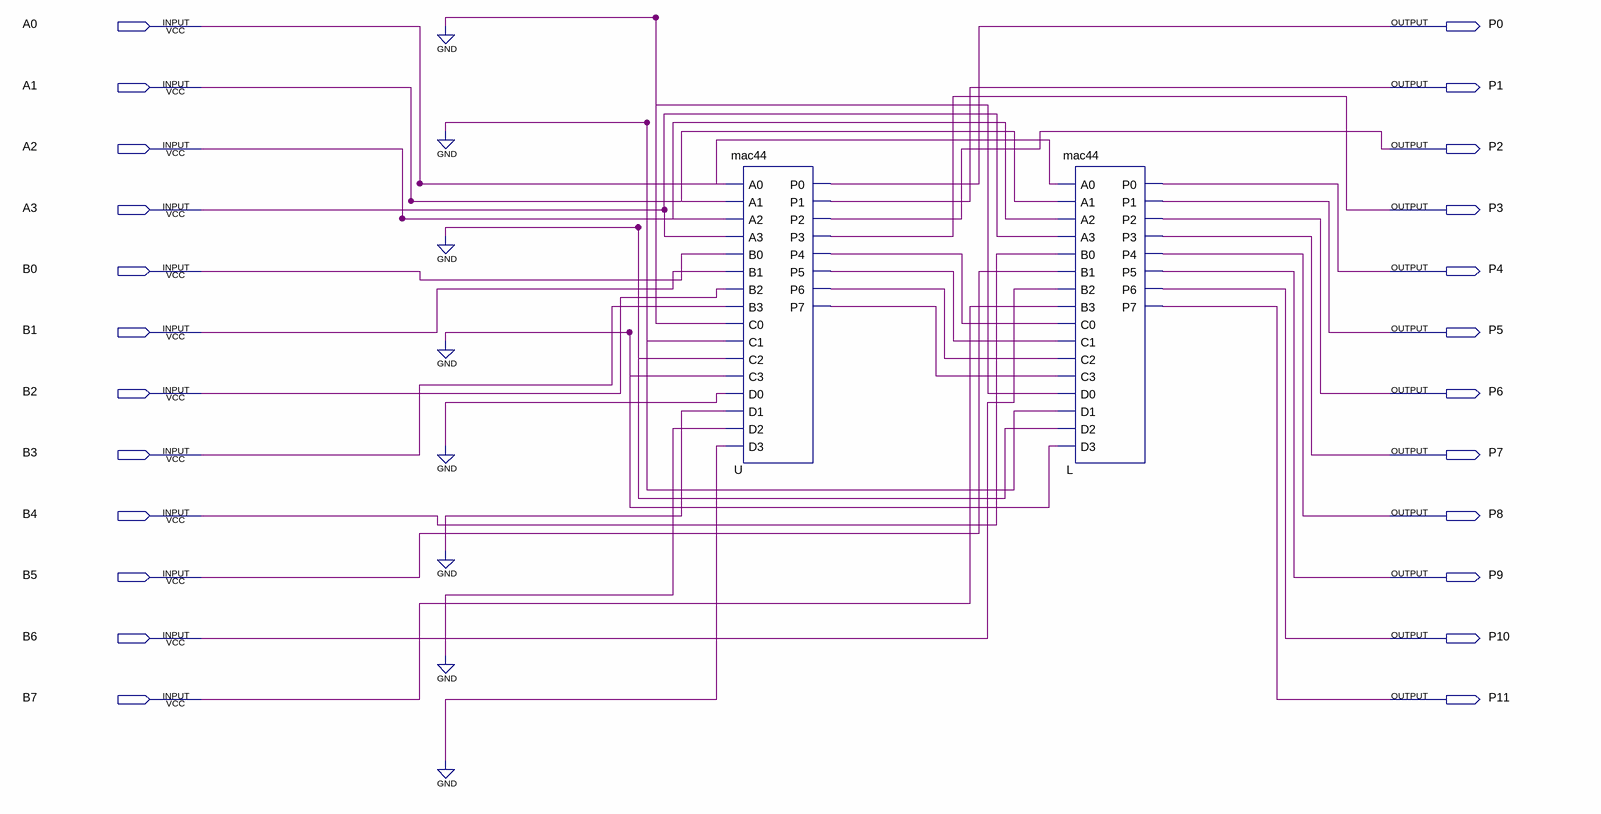
[diagram p0: schematic sheet]
// Quartus schematic mac48a.bdf as structural Verilog: 2 symbols, 24 pins
module mac48a (
  input  A0,
  input  A1,
  input  A2,
  input  A3,
  input  B0,
  input  B1,
  input  B2,
  input  B3,
  input  B4,
  input  B5,
  input  B6,
  input  B7,
  output P0,
  output P1,
  output P2,
  output P3,
  output P4,
  output P5,
  output P6,
  output P7,
  output P8,
  output P9,
  output P10,
  output P11
);

  wire U_p4, U_p5, U_p6, U_p7;

  mac44 U (
    .A0(A0), .A1(A1), .A2(A2), .A3(A3), .B0(B0), .B1(B1), .B2(B2), .B3(B3), .C0(1'b0), .C1(1'b0), .C2(1'b0),
    .C3(1'b0), .D0(1'b0), .D1(1'b0), .D2(1'b0), .D3(1'b0), .P0(P0), .P1(P1), .P2(P2), .P3(P3), .P4(U_p4),
    .P5(U_p5), .P6(U_p6), .P7(U_p7));
  mac44 L (
    .A0(A0), .A1(A1), .A2(A2), .A3(A3), .B0(B4), .B1(B5), .B2(B6), .B3(B7), .C0(U_p4), .C1(U_p5), .C2(U_p6),
    .C3(U_p7), .D0(1'b0), .D1(1'b0), .D2(1'b0), .D3(1'b0), .P0(P4), .P1(P5), .P2(P6), .P3(P7), .P4(P8),
    .P5(P9), .P6(P10), .P7(P11));
endmodule
